# Altium schematic sheet TEC_H_Bridge.SchDoc
size A3; SheetNumber: 1; SheetTotal: 4; SheetSize: A3
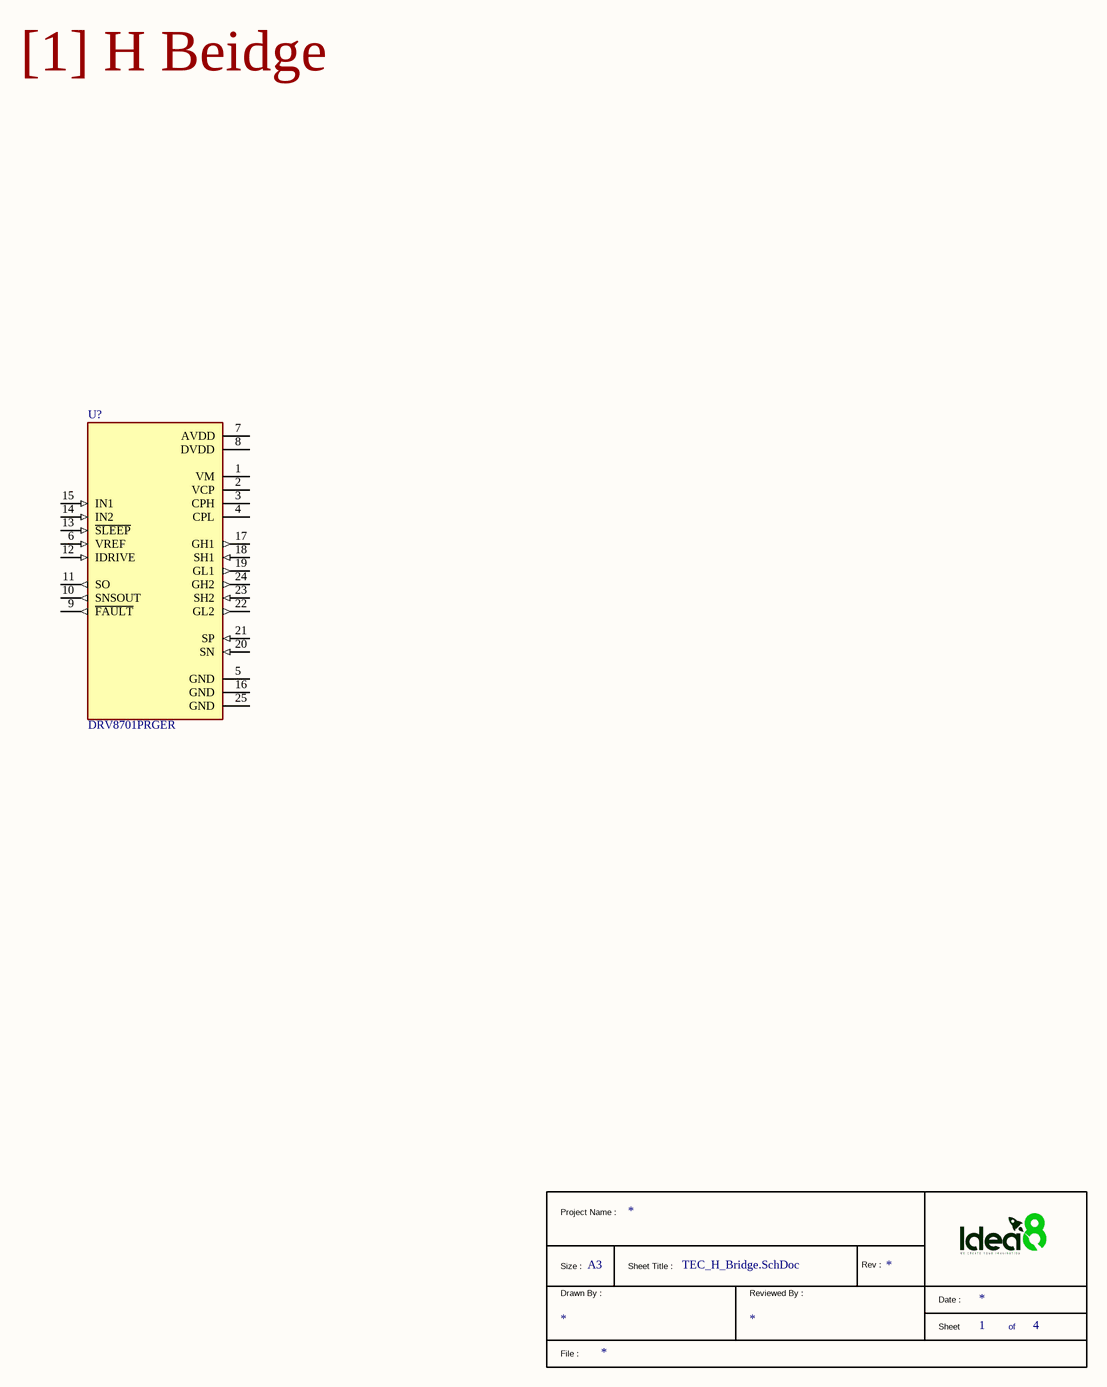
[diagram p0: TEC_H_Bridge.SchDoc]

## Parts
*  TitleBlock1  (value not drawn)  (graphical)
U?  DRV8701PRGER  [DRV8701PRGER_VQFN-24-EP(4x4)]

## Nets

Not connected (* = marked no-connect by the designer): U? 1(VM) 2(VCP) 3(CPH) 4(CPL) 5(GND) 6(VREF) 7(AVDD) 8(DVDD) 9(~{FAULT}) 10(SNSOUT) 11(SO) 12(IDRIVE) 13(~{SLEEP}) 14(IN2) 15(IN1) 16(GND) 17(GH1) 18(SH1) 19(GL1) 20(SN) 21(SP) 22(GL2) 23(SH2) 24(GH2) 25(GND)

## Notes on the sheet
- [1] H Beidge
- (in symbol TitleBlock1) Project Name :; Size :; Sheet Title :; Rev :; Drawn By :; Reviewed By :; Date :; Sheet; of; File :

## Library data of the parts
U? = TI DRV8701PRGER: Brushed DC Motor Full-Bridge Gate Driver; Manufacturer: TI; Manufacturer Part Number: DRV8701PRGER; DigiKey Part Number: 296-46293-2-ND; LCSC Part Number: C114178; Mouser Part Number: 595-DRV8701PRGER; Package: VQFN-24-EP(4x4); Type: SMD